# Altium schematic sheet PowerPanel_4_MCU_USB.SchDoc
size 594 x 420 mm; SheetNumber: 5; SheetTotal: 6
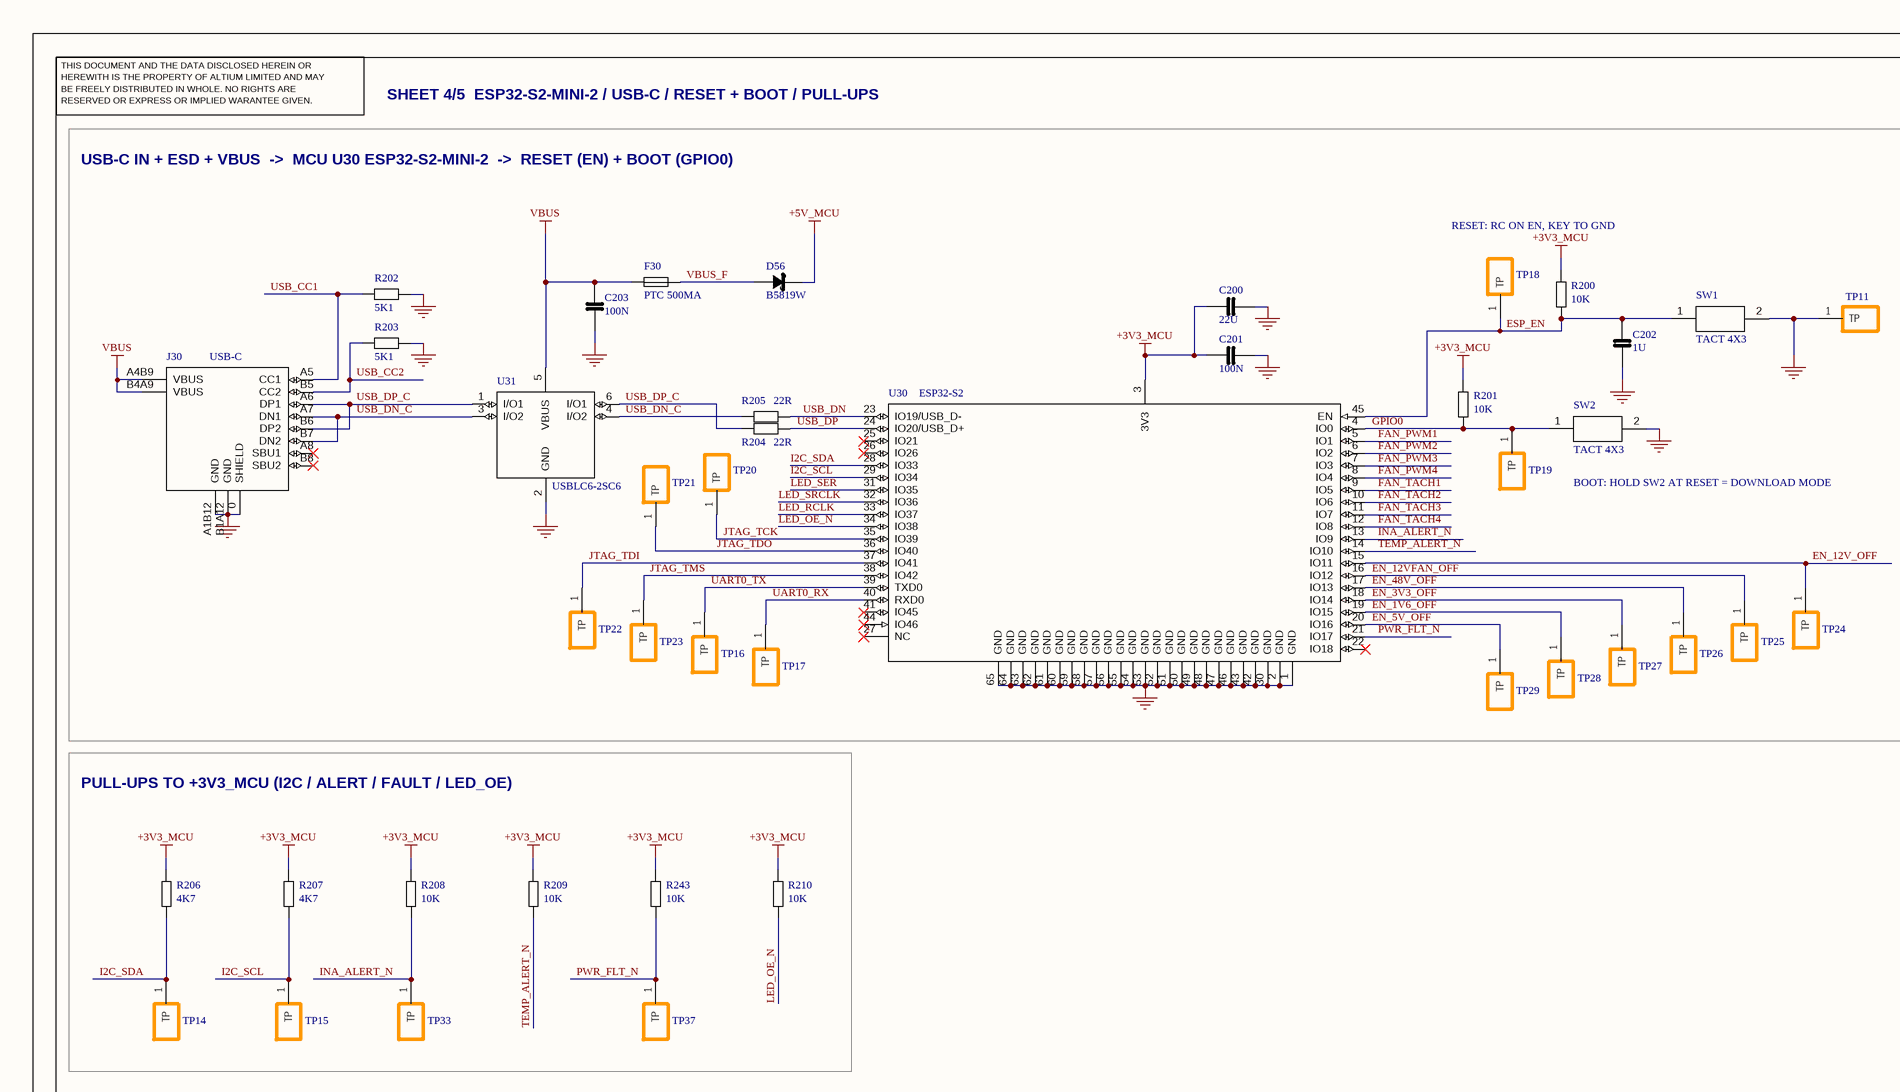
[diagram p0: PowerPanel_4_MCU_USB.SchDoc, top left]
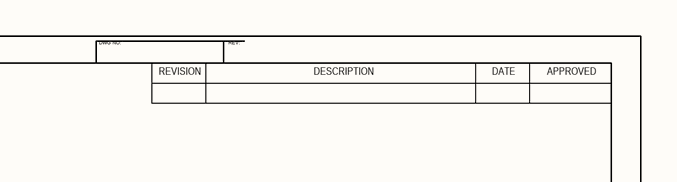
[diagram p1: PowerPanel_4_MCU_USB.SchDoc, top right]
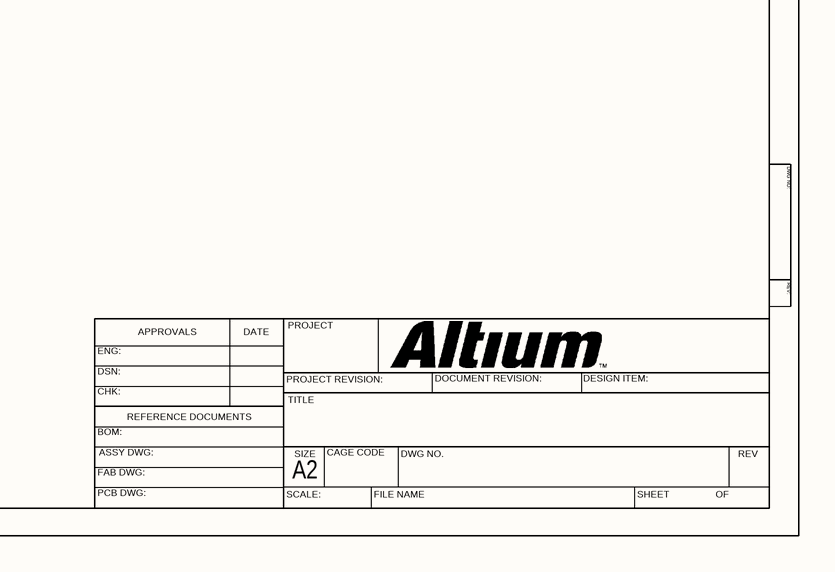
[diagram p2: PowerPanel_4_MCU_USB.SchDoc, bottom right]

## Parts
C200  22U  [CAP0805]
C201  100N  [CAP0603]
C202  1U  [CAP0603]
C203  100N  [CAP0603]
D56  B5819W  [SOD-123]
F30  PTC 500MA  [FUSE1206]
J30  USB-C  [USB-C_TYPE-C-16P-QTWT]
R200  10K  [R0603]
R201  10K  [R0603]
R202  5K1  [R0603]
R203  5K1  [R0603]
R204  22R  [R0603]
R205  22R  [R0603]
R206  4K7  [R0603]
R207  4K7  [R0603]
R208  10K  [R0603]
R209  10K  [R0603]
R210  10K  [R0603]
R243  10K  [R0603]
SW1  TACT 4X3  [SW_TS-1088]
SW2  TACT 4X3  [SW_TS-1088]
TP11  TP  [TESTPOINT]  (value not drawn)
TP14  TP  [TESTPOINT]  (value not drawn)
TP15  TP  [TESTPOINT]  (value not drawn)
TP16  TP  [TESTPOINT]  (value not drawn)
TP17  TP  [TESTPOINT]  (value not drawn)
TP18  TP  [TESTPOINT]  (value not drawn)
TP19  TP  [TESTPOINT]  (value not drawn)
TP20  TP  [TESTPOINT]  (value not drawn)
TP21  TP  [TESTPOINT]  (value not drawn)
TP22  TP  [TESTPOINT]  (value not drawn)
TP23  TP  [TESTPOINT]  (value not drawn)
TP24  TP  [TESTPOINT]  (value not drawn)
TP25  TP  [TESTPOINT]  (value not drawn)
TP26  TP  [TESTPOINT]  (value not drawn)
TP27  TP  [TESTPOINT]  (value not drawn)
TP28  TP  [TESTPOINT]  (value not drawn)
TP29  TP  [TESTPOINT]  (value not drawn)
TP33  TP  [TESTPOINT]  (value not drawn)
TP37  TP  [TESTPOINT]  (value not drawn)
U30  ESP32-S2  [MOD_ESP32-S2-MINI-2]
U31  USBLC6-2SC6  [SOT-23-6]

## Blocks framed on the sheet
PULL-UPS TO +3V3_MCU (I2C / ALERT / FAULT / LED_OE): R206-R210 R243 TP14 TP15 TP33 TP37

## Nets
+3V3_MCU: C200.1 C201.1 R200.1 R201.1 R206.1 R207.1 R208.1 R209.1 R210.1 R243.1 U30.3(3V3)
+5V_MCU: D56.1(K)
GND: C200.2 C201.2 C202.2 C203.2 J30.0(SHIELD) J30.A1B12(GND) J30.B1A12(GND) R202.2 R203.2 SW1.2 SW2.2 TP11.1(TP) U30.1(GND) U30.2(GND) U30.30(GND) U30.42(GND) U30.43(GND) U30.46(GND) U30.47(GND) U30.48(GND) U30.49(GND) U30.50(GND) U30.51(GND) U30.52(GND) U30.53(GND) U30.54(GND) U30.55(GND) U30.56(GND) U30.57(GND) U30.58(GND) U30.59(GND) U30.60(GND) U30.61(GND) U30.62(GND) U30.63(GND) U30.64(GND) U30.65(GND) U31.2(GND)
VBUS: C203.1 F30.1 J30.A4B9(VBUS) J30.B4A9(VBUS) U31.5(VBUS)
EN_1V6_OFF: TP28.1(TP) U30.19(IO15)
EN_3V3_OFF: TP27.1(TP) U30.18(IO14)
EN_5V_OFF: TP29.1(TP) U30.20(IO16)
EN_12V_OFF: TP24.1(TP) U30.15(IO11)
EN_12VFAN_OFF: TP25.1(TP) U30.16(IO12)
EN_48V_OFF: TP26.1(TP) U30.17(IO13)
ESP_EN: C202.1 R200.2 SW1.1 TP18.1(TP) U30.45(EN)
FAN_PWM1: U30.5(IO1)
FAN_PWM2: U30.6(IO2)
FAN_PWM3: U30.7(IO3)
FAN_PWM4: U30.8(IO4)
FAN_TACH1: U30.9(IO5)
FAN_TACH2: U30.10(IO6)
FAN_TACH3: U30.11(IO7)
FAN_TACH4: U30.12(IO8)
GPIO0: R201.2 SW2.1 TP19.1(TP) U30.4(IO0)
I2C_SCL: R207.2 TP15.1(TP) U30.29(IO34)
I2C_SDA: R206.2 TP14.1(TP) U30.28(IO33)
INA_ALERT_N: R208.2 TP33.1(TP) U30.13(IO9)
JTAG_TCK: TP20.1(TP) U30.35(IO39)
JTAG_TDI: TP22.1(TP) U30.37(IO41)
JTAG_TDO: TP21.1(TP) U30.36(IO40)
JTAG_TMS: TP23.1(TP) U30.38(IO42)
LED_OE_N: R210.2 U30.34(IO38)
LED_RCLK: U30.33(IO37)
LED_SER: U30.31(IO35)
LED_SRCLK: U30.32(IO36)
PWR_FLT_N: R243.2 TP37.1(TP) U30.21(IO17)
TEMP_ALERT_N: R209.2 U30.14(IO10)
UART0_RX: TP17.1(TP) U30.40(RXD0)
UART0_TX: TP16.1(TP) U30.39(TXD0)
USB_CC1: J30.A5(CC1) R202.1
USB_CC2: J30.B5(CC2) R203.1
USB_DN: R205.2 U30.23(IO19/USB_D-)
USB_DN_C: J30.A7(DN1) J30.B7(DN2) R205.1 U31.3(I/O2) U31.4(I/O2)
USB_DP: R204.2 U30.24(IO20/USB_D+)
USB_DP_C: J30.A6(DP1) J30.B6(DP2) R204.1 U31.1(I/O1) U31.6(I/O1)
VBUS_F: D56.2(A) F30.2

Not connected (* = marked no-connect by the designer): J30 A8(SBU1)* B8(SBU2)*; U30 22(IO18)* 25(IO21)* 26(IO26)* 27(NC)* 41(IO45)* 44(IO46)*

## Notes on the sheet
- DWG NO:
- REV:
- THIS DOCUMENT AND THE DATA DISCLOSED HEREIN OR
- HEREWITH IS THE PROPERTY OF ALTIUM LIMITED AND MAY
- BE FREELY DISTRIBUTED IN WHOLE. NO RIGHTS ARE
- RESERVED OR EXPRESS OR IMPLIED WARANTEE GIVEN.
- SHEET 4/5  ESP32-S2-MINI-2 / USB-C / RESET + BOOT / PULL-UPS
- REVISION
- DESCRIPTION
- DATE
- APPROVED
- USB-C IN + ESD + VBUS  ->  MCU U30 ESP32-S2-MINI-2  ->  RESET (EN) + BOOT (GPIO0)
- RESET: RC ON EN, KEY TO GND
- BOOT: HOLD SW2 AT RESET = DOWNLOAD MODE
- ENG:
- APPROVALS
- PROJECT
- DSN:
- CHK:
- REFERENCE DOCUMENTS
- PROJECT REVISION:
- TITLE
- DOCUMENT REVISION:
- DESIGN ITEM:
- BOM:
- FAB DWG:
- PCB DWG:
- ASSY DWG:
- SCALE:
- A2
- SIZE
- CAGE CODE
- FILE NAME
- DWG NO.
- SHEET
- OF
- REV

## Library data of the parts
C200 = C_22U_0805: CAP // 22U // 25V // X5R // 0805; MFR: Samsung Electro-Mechanics; MPN: CL21A226MAQNNNE; Value: 22U; LCSC: C45783; JLC_TYPE: BASIC; JLC_CHECKED: 2026-09-29 STOCK 4065880; Datasheet: https://www.lcsc.com/datasheet/lcsc_datasheet_2304140030_Samsung-Electro-Mechanics-CL21A226MAQNNNE_C45783.pdf
C201 C203 = C_100N_0603: CAP // 100N // 50V // X7R // 0603; MFR: YAGEO; MPN: CC0603KRX7R9BB104; Value: 100N; LCSC: C14663; JLC_TYPE: BASIC; JLC_CHECKED: 2026-09-29 STOCK 55887132; Datasheet: https://www.lcsc.com/datasheet/lcsc_datasheet_2211101700_YAGEO-CC0603KRX7R9BB104_C14663.pdf
C202 = C_1U_0603: CAP // 1U // 50V // X5R // 0603; MFR: Samsung Electro-Mechanics; MPN: CL10A105KB8NNNC; Value: 1U; LCSC: C15849; JLC_TYPE: BASIC; JLC_CHECKED: 2026-09-29 STOCK 6435528; Datasheet: https://www.lcsc.com/datasheet/lcsc_datasheet_2304140030_Samsung-Electro-Mechanics-CL10A105KB8NNNC_C15849.pdf
D56 = D_B5819W: SCHOTTKY // 40V 1A // 600MV // SOD-123; MFR: Jiangsu Changjing Electronics Technology Co., Ltd.; MPN: B5819W SL; Value: B5819W; LCSC: C8598; JLC_TYPE: BASIC; JLC_CHECKED: 2026-09-29 STOCK 545116; Datasheet: https://www.lcsc.com/datasheet/lcsc_datasheet_2304140030_Jiangsu-Changjing-Electronics-Technology-Co---Ltd--B5819W-SL_C8598.pdf
F30 = F_PTC_500MA_1206: PTC FUSE // 500MA HOLD // 1A TRIP // 30V // 1206; MFR: BHFUSE; MPN: BSMD1206-050-30V; Value: 500MA; LCSC: C883126; JLC_TYPE: EXTENDED; JLC_CHECKED: 2026-09-29 STOCK 92778; Datasheet: https://www.lcsc.com/datasheet/lcsc_datasheet_2305121423_BHFUSE-BSMD1206-050-30V_C883126.pdf
J30 = J_USBC_16P_QTWT: CONN // USB-C RECEPT // USB2.0 16P // 3A 5V // SMD RA; MFR: SHOU HAN; MPN: TYPE-C 16P QTWT; Value: 16P; LCSC: C5187472; JLC_TYPE: EXTENDED; JLC_CHECKED: 2026-10-03 STOCK 77988; Datasheet: https://wmsc.lcsc.com/wmsc/upload/file/pdf/v2/lcsc/2209291730_SHOU-HAN-TYPE-C-16P-QTWT_C5187472.pdf
R200 R201 R208-R210 R243 = R_10K_0603: RES // 10K // 1% // 100MW // 0603; MFR: UNI-ROYAL(Uniroyal Elec); MPN: 0603WAF1002T5E; Value: 10K; LCSC: C25804; JLC_TYPE: BASIC; JLC_CHECKED: 2026-09-29 STOCK 21309815; Datasheet: https://www.lcsc.com/datasheet/lcsc_datasheet_2206010045_UNI-ROYAL-Uniroyal-Elec-0603WAF1002T5E_C25804.pdf
R202 R203 = R_5K1_0603: RES // 5K1 // 1% // 100MW // 0603; MFR: UNI-ROYAL(Uniroyal Elec); MPN: 0603WAF5101T5E; Value: 5K1; LCSC: C23186; JLC_TYPE: BASIC; JLC_CHECKED: 2026-09-29 STOCK 25577365; Datasheet: https://www.lcsc.com/datasheet/lcsc_datasheet_2206010116_UNI-ROYAL-Uniroyal-Elec-0603WAF5101T5E_C23186.pdf
R204 R205 = R_22R_0603: RES // 22R // 1% // 100MW // 0603; MFR: UNI-ROYAL(Uniroyal Elec); MPN: 0603WAF220JT5E; Value: 22R; LCSC: C23345; JLC_TYPE: BASIC; JLC_CHECKED: 2026-09-29 STOCK 9242496; Datasheet: https://www.lcsc.com/datasheet/lcsc_datasheet_2206010100_UNI-ROYAL-Uniroyal-Elec-0603WAF220JT5E_C23345.pdf
R206 R207 = R_4K7_0603: RES // 4K7 // 1% // 100MW // 0603; MFR: UNI-ROYAL(Uniroyal Elec); MPN: 0603WAF4701T5E; Value: 4K7; LCSC: C23162; JLC_TYPE: BASIC; JLC_CHECKED: 2026-09-29 STOCK 22752027; Datasheet: https://www.lcsc.com/datasheet/lcsc_datasheet_2206010116_UNI-ROYAL-Uniroyal-Elec-0603WAF4701T5E_C23162.pdf
SW1 SW2 = SW_TACT_4X3: SW // TACT SPST // 160GF // 50MA 12V // SMD 3.9X3.0; MFR: XUNPU; MPN: TS-1088-AR02016; Value: SPST; LCSC: C720477; JLC_TYPE: BASIC; JLC_CHECKED: 2026-09-29 STOCK 884099; Datasheet: https://www.lcsc.com/datasheet/lcsc_datasheet_2304140030_XUNPU-TS-1088-AR02016_C720477.pdf
TP11 TP14-TP29 TP33 TP37 = TP: TP // SMD PAD // 1.5MM; MPN: TEST POINT (NOT A BOM PART)
U30 = U_ESP32-S2-MINI-2-N4: MODULE // ESP32-S2 // WIFI4 // 4MB FLASH // PCB ANT // LGA-65 15.4X20.5; MFR: Espressif Systems; Value: ESP32-S2-MINI-2-N4; MPN: ESP32-S2-MINI-2-N4; LCSC: C3013906; JLC_TYPE: EXTENDED; JLC_CHECKED: 2026-10-03 STOCK 2429; Datasheet: https://wmsc.lcsc.com/wmsc/upload/file/pdf/v2/lcsc/2208151830_Espressif-Systems-ESP32-S2-MINI-2-N4_C3013906.pdf
U31 = U_USBLC6-2SC6: ESD // USB2 // 2CH // SOT-23-6; MFR: UMW(Youtai Semiconductor Co., Ltd.); Value: USBLC6-2SC6; MPN: USBLC6-2SC6; LCSC: C2687116; JLC_TYPE: EXTENDED; JLC_CHECKED: 2026-09-29 STOCK 79878; Datasheet: https://www.lcsc.com/datasheet/lcsc_datasheet_2311091738_UMW-Youtai-Semiconductor-Co---Ltd--USBLC6-2SC6_C2687116.pdf